# Altium project Trung Flight Controller.PrjPcb
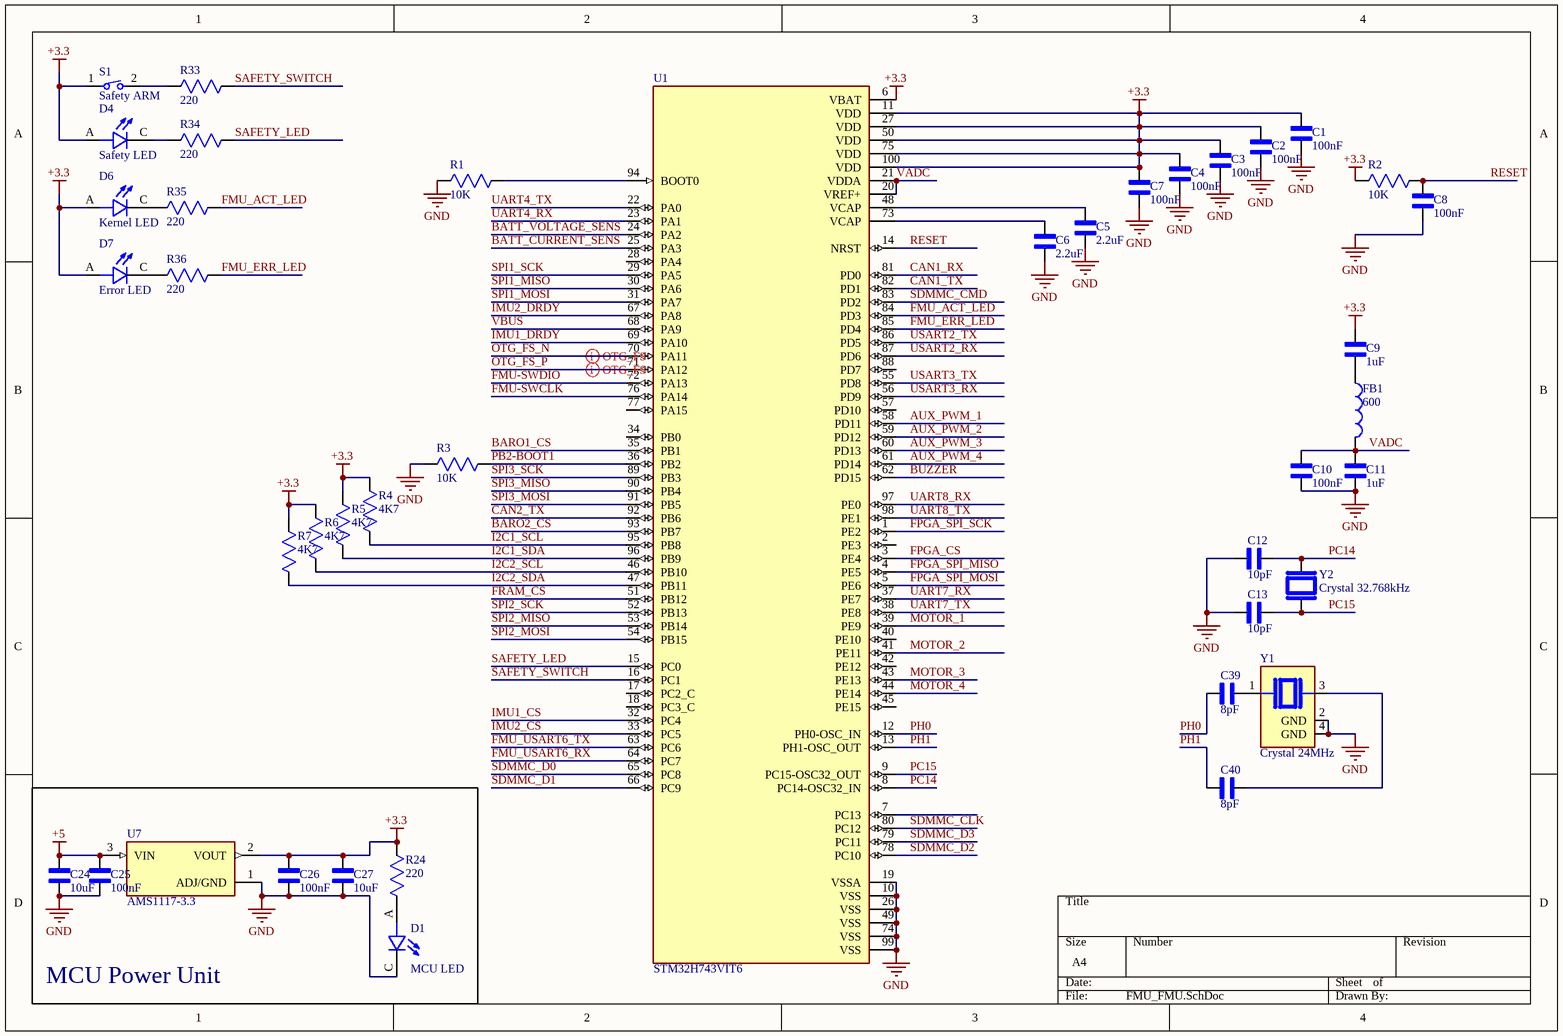
[diagram p0: FMU_FMU.SchDoc]
5 sheets, 114 parts. Net scope: global (net labels, ports and power ports of the same name join across sheets).
Board file: Trung PX4 Flight Controller PCB.PcbDoc
Sheets:
  FMU_FMU.SchDoc
  SD_FMU.SchDoc
  Sensor_FMU.SchDoc
  PWM_FMU.SchDoc
  Connector_FMU.SchDoc

## Sheet FMU_FMU.SchDoc
size A4; SheetNumber: 1; SheetTotal: 5

### Parts
C1  100nF  [CAPC1608X90N]
C2  100nF  [CAPC1608X90N]
C3  100nF  [CAPC1608X90N]
C4  100nF  [CAPC1608X90N]
C5  2.2uF  [CAPC1608X90N]
C6  2.2uF  [CAPC1608X90N]
C7  100nF  [CAPC1608X90N]
C8  100nF  [CAPC3216X127N]
C9  1uF  [CAPC1608X90N]
C10  100nF  [CAPC1608X90N]
C11  1uF  [CAPC1608X90N]
C12  10pF  [CAPC1608X90N]
C13  10pF  [CAPC1608X90N]
C24  10uF  [CAPC3216X110N]
C25  100nF  [CAPC2012X135N]
C26  100nF  [CAPC2012X135N]
C27  10uF  [CAPC3216X110N]
C39  8pF  [CAPC1005X55N]
C40  8pF  [CAPC1005X55N]
D1  MCU LED  [LEDSC125X200X90-2N]
D4  Safety LED  [LEDSC125X200X90-2N]
D6  Kernel LED  [LEDSC125X200X90-2N]
D7  Error LED  [LEDSC125X200X90-2N]
FB1  600  [WE-CBA_0805_W4.0]
R1  10K  [RESC2013X65N]
R2  10K  [RESC2013X65N]
R3  10K  [RESC2013X65N]
R4  4K7  [RESC2013X65N]
R5  4K7  [RESC2013X65N]
R6  4K7  [RESC2013X65N]
R7  4K7  [RESC2013X65N]
R24  220  [RESC2013X65N]
R33  220  [RESC2013X65N]
R34  220  [RESC2013X65N]
R35  220  [RESC2013X65N]
R36  220  [RESC2013X65N]
S1  Safety ARM  [434781025816]
U1  STM32H743VIT6  [QFP50P1600X1600X160-100N]
U7  AMS1117-3.3  [SOT229P700X180-4N]
Y1  Crystal 24MHz  [XTAL_ABM8G-24.000MHZ-B4Y-T]
Y2  Crystal 32.768kHz  [XTAL_CC7V-T1A-32.768KHZ-7PF-100PPM-TA-QC]

### Blocks framed on the sheet
MCU Power Unit: C24-C27 D1 R24 U7

### Nets
+3.3: C1.2 C2.2 C3.2 C4.2 C7.2 C9.2 C26.2 C27.1 D4.A D6.A D7.A R2.2(R2) R4.1(R1) R5.1(R1) R6.1(R1) R7.1(R1) R24.1(R1) S1.1 U1.6(VBAT) U1.11(VDD) U1.27(VDD) U1.50(VDD) U1.75(VDD) U1.100(VDD) U7.2(VOUT)
+5: C24.1 C25.2 U7.3(VIN)
GND: C1.1 C2.1 C3.1 C4.1 C5.1 C6.1 C7.1 C8.1 C10.1 C11.1 C12.2 C13.2 C24.2 C25.1 C26.1 C27.2 D1.C R1.2(R2) R3.2(R2) U1.10(VSS) U1.19(VSSA) U1.26(VSS) U1.49(VSS) U1.74(VSS) U1.99(VSS) U7.1(ADJ/GND) Y1.2(GND) Y1.4(GND)
AUX_PWM_1: U1.58(PD11)
AUX_PWM_2: U1.59(PD12)
AUX_PWM_3: U1.60(PD13)
AUX_PWM_4: U1.61(PD14)
BARO1_CS: U1.35(PB1)
BARO2_CS: U1.93(PB7)
BATT_CURRENT_SENS: U1.25(PA3)
BATT_VOLTAGE_SENS: U1.24(PA2)
BUZZER: U1.62(PD15)
CAN1_RX: U1.81(PD0)
CAN1_TX: U1.82(PD1)
CAN2_TX: U1.92(PB6)
FMU-SWCLK: U1.76(PA14)
FMU-SWDIO: U1.72(PA13)
FMU_ACT_LED: R35.2(R2) U1.84(PD3)
FMU_ERR_LED: R36.2(R2) U1.85(PD4)
FMU_USART6_RX: U1.64(PC7)
FMU_USART6_TX: U1.63(PC6)
FPGA_CS: U1.3(PE4)
FPGA_SPI_MISO: U1.4(PE5)
FPGA_SPI_MOSI: U1.5(PE6)
FPGA_SPI_SCK: U1.1(PE2)
FRAM_CS: U1.51(PB12)
I2C1_SCL: R4.2(R2) U1.95(PB8)
I2C1_SDA: R5.2(R2) U1.96(PB9)
I2C2_SCL: R6.2(R2) U1.46(PB10)
I2C2_SDA: R7.2(R2) U1.47(PB11)
IMU1_CS: U1.32(PC4)
IMU1_DRDY: U1.69(PA10)
IMU2_CS: U1.33(PC5)
IMU2_DRDY: U1.67(PA8)
MOTOR_1: U1.39(PE9)
MOTOR_2: U1.41(PE11)
MOTOR_3: U1.43(PE13)
MOTOR_4: U1.44(PE14)
OTG_FS_N: U1.70(PA11)
OTG_FS_P: U1.71(PA12)
PB2-BOOT1: R3.1(R1) U1.36(PB2)
PC14: C12.1 U1.8(PC14-OSC32_IN) Y2.2
PC15: C13.1 U1.9(PC15-OSC32_OUT) Y2.1
PH0: C39.1 U1.12(PH0-OSC_IN)
PH1: C40.1 U1.13(PH1-OSC_OUT)
RESET: C8.2 R2.1(R1) U1.14(NRST)
SAFETY_LED: R34.2(R2) U1.15(PC0)
SAFETY_SWITCH: R33.2(R2) U1.16(PC1)
SDMMC_CLK: U1.80(PC12)
SDMMC_CMD: U1.83(PD2)
SDMMC_D0: U1.65(PC8)
SDMMC_D1: U1.66(PC9)
SDMMC_D2: U1.78(PC10)
SDMMC_D3: U1.79(PC11)
SPI1_MISO: U1.30(PA6)
SPI1_MOSI: U1.31(PA7)
SPI1_SCK: U1.29(PA5)
SPI2_MISO: U1.53(PB14)
SPI2_MOSI: U1.54(PB15)
SPI2_SCK: U1.52(PB13)
SPI3_MISO: U1.90(PB4)
SPI3_MOSI: U1.91(PB5)
SPI3_SCK: U1.89(PB3)
UART4_RX: U1.23(PA1)
UART4_TX: U1.22(PA0)
UART7_RX: U1.37(PE7)
UART7_TX: U1.38(PE8)
UART8_RX: U1.97(PE0)
UART8_TX: U1.98(PE1)
USART2_RX: U1.87(PD6)
USART2_TX: U1.86(PD5)
USART3_RX: U1.56(PD9)
USART3_TX: U1.55(PD8)
VADC: C10.2 C11.2 FB1.2 U1.20(VREF+) U1.21(VDDA)
VBUS: U1.68(PA9)
NetC5_2: C5.2 U1.48(VCAP)
NetC6_2: C6.2 U1.73(VCAP)
NetC9_1: C9.1 FB1.1
NetC39_2: C39.2 Y1.1
NetC40_2: C40.2 Y1.3
NetD1_A: D1.A R24.2(R2)
NetD4_C: D4.C R34.1(R1)
NetD6_C: D6.C R35.1(R1)
NetD7_C: D7.C R36.1(R1)
NetR1_1: R1.1(R1) U1.94(BOOT0)
NetR33_1: R33.1(R1) S1.2

Not connected (* = marked no-connect by the designer): U1 2(PE3) 7(PC13) 17(PC2_C) 18(PC3_C) 28(PA4) 34(PB0) 40(PE10) 42(PE12) 45(PE15) 57(PD10) 77(PA15) 88(PD7)

### Layout directives
differential pair: OTG_FS_N, OTG_FS_P

### Library data of the parts
C1-C7 C9-C13 = GRM188R71H104KA93D: SMD Capacitor X7R(EIA) with Capacitance: 0.10uF Tol. 10%. Rated Voltage: 50Vdc; MF: Murata; SnapEDA_Link: https://www.snapeda.com/parts/GRM188R71H104KA93D/Murata/view-part/?ref=snap; Package: 1608 Murata; Value: *; MP: GRM188R71H104KA93D; Check_prices: https://www.snapeda.com/parts/GRM188R71H104KA93D/Murata/view-part/?ref=eda
C8 = 12061C104KAT2A: 0.1 ÂµF Â±10% 100V Ceramic Capacitor X7R 1206 (3216 Metric); MF: KYOCERA AVX; SnapEDA_Link: https://www.snapeda.com/parts/12061C104KAT2A/Kyocera/view-part/?ref=snap; Package: 3216 AVX; Value: *; MP: 12061C104KAT2A; Check_prices: https://www.snapeda.com/parts/12061C104KAT2A/Kyocera/view-part/?ref=eda
C24 C27 = T491A106K010AT7280: 10 ÂµF Molded Tantalum Capacitors 10 V 1206 (3216 Metric) 3.8Ohm; MF: KEMET; SnapEDA_Link: https://www.snapeda.com/parts/T491A106K010AT7280/KEMET/view-part/?ref=snap; Package: SMD-2 KEMET; Value: *; MP: T491A106K010AT7280; Check_prices: https://www.snapeda.com/parts/T491A106K010AT7280/KEMET/view-part/?ref=eda
C25 C26 = GRM21BR71H104KA01L: ÐšÐ¾Ð½Ð´ÐµÐ½ÑÐ°Ñ‚Ð¾Ñ€ SMD X7R(EIA) Ñ Ñ‘Ð¼ÐºÐ¾ÑÑ‚ÑŒÑŽ: 0,10 Ð¼ÐºÐ¤ Â± 10%. ÐÐ¾Ð¼Ð¸Ð½Ð°Ð»ÑŒÐ½Ð¾Ðµ Ð½Ð°Ð¿Ñ€ÑÐ¶ÐµÐ½Ð¸Ðµ: 50 Ð’ Ð¿Ð¾ÑÑ‚Ð¾ÑÐ½Ð½Ð¾Ð³Ð¾ Ñ‚Ð¾ÐºÐ°; MF: Murata; SnapEDA_Link: https://www.snapeda.com/parts/GRM21BR71H104KA01L/Murata/view-part/?ref=snap; Package: 805-2 Murata; Value: *; MP: GRM21BR71H104KA01L; Check_prices: https://www.snapeda.com/parts/GRM21BR71H104KA01L/Murata/view-part/?ref=eda
C39 C40 = C1005C0G1H080D050BA: 8 pF Â±0.5pF 50V Ceramic Capacitor C0G, NP0 0402 (1005 Metric); MF: TDK; SnapEDA_Link: https://www.snapeda.com/parts/C1005C0G1H080D050BA/TDK/view-part/?ref=snap; Package: 1005 TDK; Value: *; MP: C1005C0G1H080D050BA; Check_prices: https://www.snapeda.com/parts/C1005C0G1H080D050BA/TDK/view-part/?ref=eda
D1 D4 D6 D7 = 5990110007F: Red 633nm LED Indication - Discrete 2.1V 0805 (2012 Metric); MF: Dialight; MP: 599-0110-007F; Check_prices: https://www.snapeda.com/parts/599-0110-007F/Dialight/view-part/?ref=eda; Value: *; Purchase-URL: https://pricing.snapeda.com/search/part/599-0110-007F/?ref=eda; Price: None; SnapEDA_Link: https://www.snapeda.com/parts/599-0110-007F/Dialight/view-part/?ref=snap; Availability: In Stock; Package: 0805 Dialight
FB1 = WE-CBA_0805: FERRITE BEAD 560 OHM 0805 1LN; MF: WÃ¼rth Elektronik; MP: 782853561; SnapEDA_Link: https://www.snapeda.com/parts/782853561/W%25C3%25BCrth+Elektronik+Midcom/view-part/?ref=snap; Package: 0805 Wurth Elektronik; Value: *; Check_prices: https://www.snapeda.com/parts/782853561/W%25C3%25BCrth+Elektronik+Midcom/view-part/?ref=eda
R1-R7 R24 R33-R36 = RC0805FR-075K1L: 5.1 kOhms Â±1% 0.125W, 1/8W Chip Resistor 0805 (2012 Metric) Moisture Resistant Thick Film; MF: Yageo; MP: RC0805FR075K1L; SnapEDA_Link: https://www.snapeda.com/parts/RC0805FR075K1L/Yageo/view-part/?ref=snap; Package: 0805-2 YAGEO; Value: *; Check_prices: https://www.snapeda.com/parts/RC0805FR075K1L/Yageo/view-part/?ref=eda
S1 = 434781025816: 6.2*4.1mm IP67 vertical type, SMT, height 2.5mm, Black silicone rubber actuator, 160gf, T&R; MF: Wurth Elektronik; SnapEDA_Link: https://www.snapeda.com/parts/434781025816/Wurth+Electronics/view-part/?ref=snap; Package: None; Value: *; MP: 434781025816; Check_prices: https://www.snapeda.com/parts/434781025816/Wurth+Electronics/view-part/?ref=eda
U1 = STM32H743VIT6: ARMÂ® CortexÂ®-M7 STM32H7 Microcontroller IC 32-Bit Single-Core 480MHz 2MB (2M x 8) FLASH 100-LQFP (14x14); MF: STMicroelectronics; SnapEDA_Link: https://www.snapeda.com/parts/STM32H743VIT6/STMicroelectronics/view-part/?ref=snap; Package: LQFP-100 STMicroelectronics; Value: *; MP: STM32H743VIT6; Check_prices: https://www.snapeda.com/parts/STM32H743VIT6/STMicroelectronics/view-part/?ref=eda
U7 = AMS1117-3.3: Linear Voltage Regulator IC Positive Fixed 1 Output 1A SOT-223-3L; MF: UMW; SnapEDA_Link: https://www.snapeda.com/parts/AMS1117-3.3/UMW/view-part/?ref=snap; Package: SOT-223-3L UMW; Value: *; MP: AMS1117-3.3; Check_prices: https://www.snapeda.com/parts/AMS1117-3.3/UMW/view-part/?ref=eda
Y1 = ABM8G-24.000MHZ-B4Y-T: 24 MHz Â±30ppm Crystal 10pF 60 Ohms 4-SMD, No Lead; MF: Abracon; Value: *; SnapEDA_Link: https://www.snapeda.com/parts/ABM8G-24.000MHZ-B4Y-T/Abracon+LLC/view-part/?ref=snap; Availability: In Stock; Price: None; Check_prices: https://www.snapeda.com/parts/ABM8G-24.000MHZ-B4Y-T/Abracon+LLC/view-part/?ref=eda; Purchase-URL: https://pricing.snapeda.com/search/part/ABM8G-24.000MHZ-B4Y-T/?ref=eda; Package: SMD-4 Abracon; MP: ABM8G-24.000MHZ-B4Y-T
Y2 = CC7V-T1A-32.768KHZ-7PF-100PPM-TA-QC: LOW FREQUENCY CRYSTAL; MF: Micro Crystal; Package: SMD-2 Micro Crystal; MP: CC7V-T1A-32.768KHZ-7PF-100PPM-TA-QC; Check_prices: https://www.snapeda.com/parts/CC7V-T1A-32.768KHZ-7PF-100PPM-TA-QC/Micro+Crystal/view-part/?ref=eda; Digi-Key_Part_Number: 2195-CC7V-T1A-32.768KHZ-7PF-100PPM-TA-QCTR-ND; Purchase-URL: https://pricing.snapeda.com/search/part/CC7V-T1A-32.768KHZ-7PF-100PPM-TA-QC/?ref=eda; Value: *; SnapEDA_Link: https://www.snapeda.com/parts/CC7V-T1A-32.768KHZ-7PF-100PPM-TA-QC/Micro+Crystal/view-part/?ref=snap

## Sheet SD_FMU.SchDoc
size A4; SheetNumber: 2; SheetTotal: 5
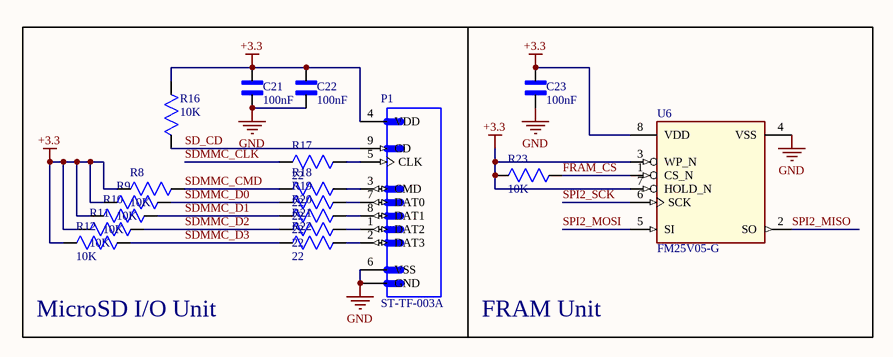
[diagram p1: SD_FMU.SchDoc]

### Parts
C21  100nF  [CAPC1608X90N]
C22  100nF  [CAPC1608X90N]
C23  100nF  [CAPC1608X90N]
P1  ST-TF-003A  [SUNTECH_ST-TF-003A]
R8  10K  [RESC2013X65N]
R9  10K  [RESC2013X65N]
R10  10K  [RESC2013X65N]
R11  10K  [RESC2013X65N]
R12  10K  [RESC2013X65N]
R16  10K  [RESC2013X65N]
R17  22  [RESC2013X65N]
R18  22  [RESC2013X65N]
R19  22  [RESC2013X65N]
R20  22  [RESC2013X65N]
R21  22  [RESC2013X65N]
R22  22  [RESC2013X65N]
R23  10K  [RESC2013X65N]
U6  FM25V05-G  [SOIC127P602X173-8N-1-V]

### Blocks framed on the sheet
MicroSD I/O Unit: C21 C22 P1 R8-R12 R16-R22
FRAM Unit: C23 R23 U6

### Nets
+3.3: C21.2 C22.2 C23.2 P1.4(VDD) R8.1(R1) R9.1(R1) R10.1(R1) R11.1(R1) R12.1(R1) R16.2(R2) R23.1(R1) U6.3(WP_N) U6.7(HOLD_N) U6.8(VDD)
GND: C21.1 C22.1 C23.1 P1.6(VSS) P1.G1(GND) P1.G2(GND) P1.G3(GND) P1.G4(GND) U6.4(VSS)
FRAM_CS: R23.2(R2) U6.1(CS_N)
SD_CD: P1.9(CD) R16.1(R1)
SDMMC_CLK: R17.1(R1)
SDMMC_CMD: R8.2(R2) R18.1(R1)
SDMMC_D0: R9.2(R2) R19.1(R1)
SDMMC_D1: R10.2(R2) R20.1(R1)
SDMMC_D2: R11.2(R2) R21.1(R1)
SDMMC_D3: R12.2(R2) R22.1(R1)
SPI2_MISO: U6.2(SO)
SPI2_MOSI: U6.5(SI)
SPI2_SCK: U6.6(SCK)
NetP1_1: P1.1(DAT2) R21.2(R2)
NetP1_2: P1.2(DAT3) R22.2(R2)
NetP1_3: P1.3(CMD) R18.2(R2)
NetP1_5: P1.5(CLK) R17.2(R2)
NetP1_7: P1.7(DAT0) R19.2(R2)
NetP1_8: P1.8(DAT1) R20.2(R2)

### Library data of the parts
C21-C23 = GRM188R71H104KA93D: as C1 on sheet FMU_FMU; SnapEDA_Link: https://www.snapeda.com/parts/GRM188R71H104KA93D/Murata/view-part/?ref=snap; Package: 1608 Murata; Value: *; MP: GRM188R71H104KA93D; Check_prices: https://www.snapeda.com/parts/GRM188R71H104KA93D/Murata/view-part/?ref=eda
P1 = ST-TF-003A: Micro SD Card Socket; Price: None; MP: ST-TF-003A; Availability: Unavailable; Value: *; Package: None
R8-R12 R16-R23 = RC0805FR-075K1L: as R1 on sheet FMU_FMU; SnapEDA_Link: https://www.snapeda.com/parts/RC0805FR075K1L/Yageo/view-part/?ref=snap; Package: 0805-2 YAGEO; Value: *; Check_prices: https://www.snapeda.com/parts/RC0805FR075K1L/Yageo/view-part/?ref=eda
U6 = FM25V05-G: 4-Kbit (512 × 8) Serial (SPI) F-RAM; Manufacturer: Infineon Technologies; PackageReference: PG-DSO-8-802; Manufacturer Order Number: FM25V05-G

## Sheet Sensor_FMU.SchDoc
size A4; SheetNumber: 3; SheetTotal: 5
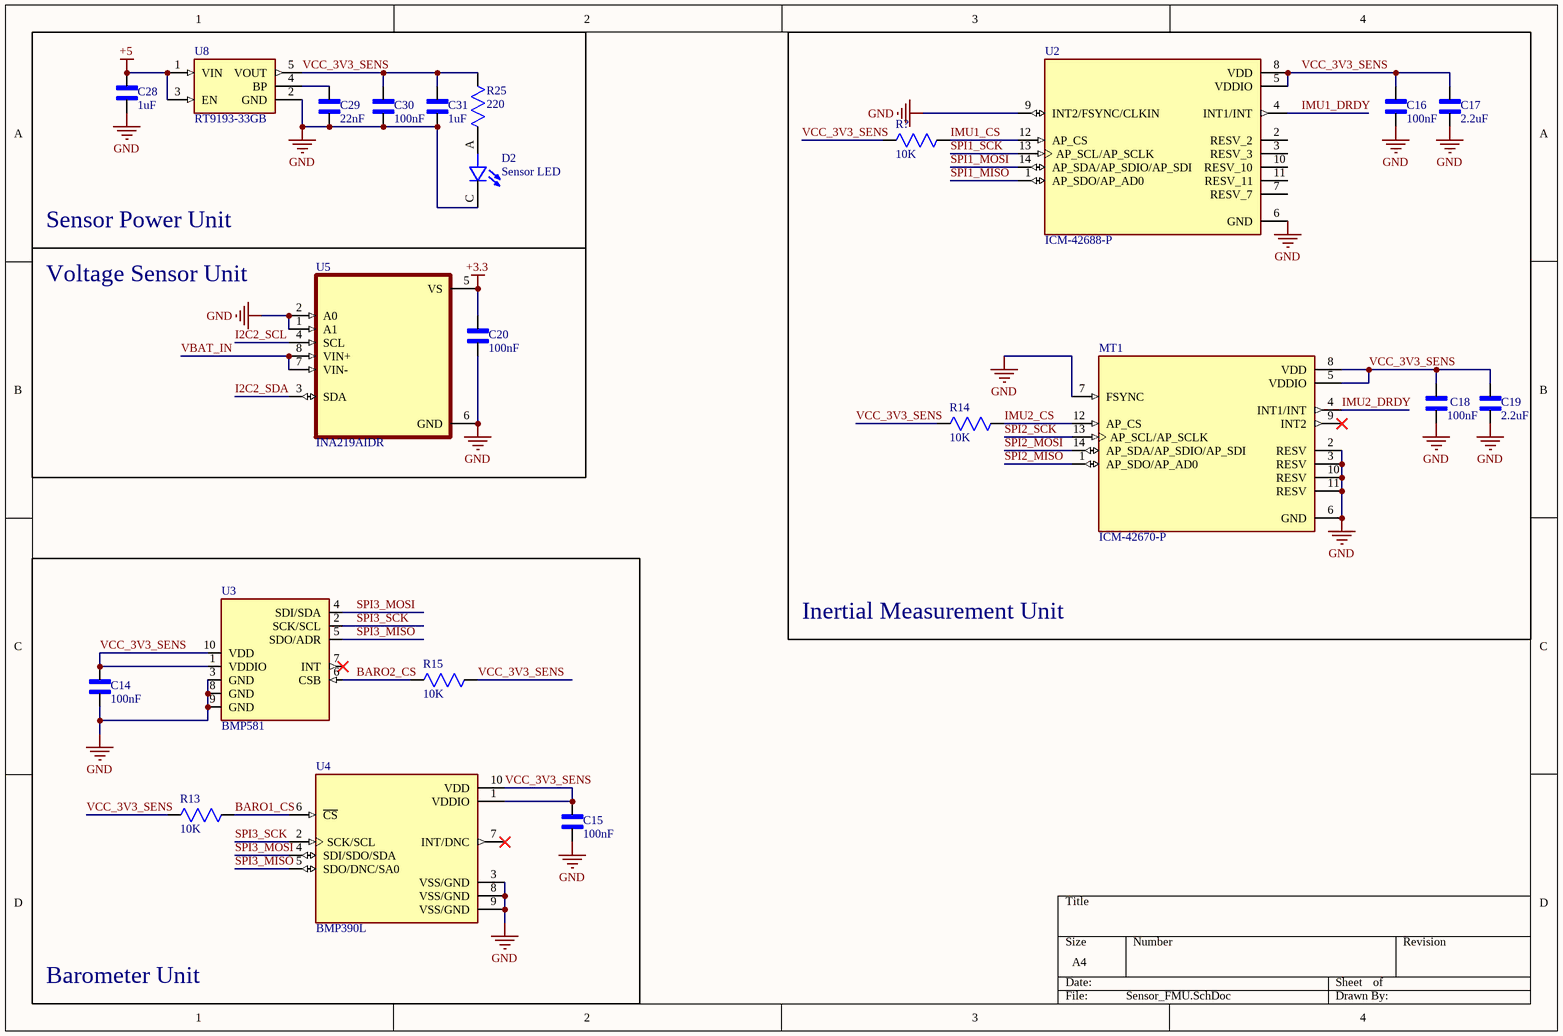
[diagram p2: Sensor_FMU.SchDoc]

### Parts
C14  100nF  [CAPC2012X135N]
C15  100nF  [CAPC2012X135N]
C16  100nF  [CAPC2012X135N]
C17  2.2uF  [CAPC2012X152N]
C18  100nF  [CAPC2012X135N]
C19  2.2uF  [CAPC2012X152N]
C20  100nF  [CAPC1608X90N]
C28  1uF  [CAPC1608X90N]
C29  22nF  [CAPC1608X90N]
C30  100nF  [CAPC1608X90N]
C31  1uF  [CAPC1608X90N]
D2  Sensor LED  [LEDSC125X200X90-2N]
MT1  ICM-42670-P  [XDCR_ICM-42670-P]
R13  10K  [RESC2013X65N]
R14  10K  [RESC2013X65N]
R15  10K  [RESC2013X65N]
R25  220  [RESC2013X65N]
R?  10K  [RESC2013X65N]
U2  ICM-42688-P  [PQFN50P300X250X97-14N]
U3  BMP581  [BMP581]
U4  BMP390L  [XDCR_BMP390L]
U5  INA219AIDR  [SOIC127P599X175-8N]
U8  RT9193-33GB  [SOT94P279X129-5N]

### Blocks framed on the sheet
Sensor Power Unit: C28-C31 D2 R25 U8
Inertial Measurement Unit: C16-C19 MT1 R14 R? U2
Voltage Sensor Unit: C20 U5
Barometer Unit: C14 C15 R13 R15 U3 U4

### Nets
+3.3: C20.2 U5.5(VS)
+5: C28.2 U8.1(VIN) U8.3(EN)
GND: C14.1 C15.1 C16.1 C17.2 C18.1 C19.2 C20.1 C28.1 C29.1 C30.1 C31.1 D2.C MT1.2(RESV) MT1.3(RESV) MT1.6(GND) MT1.7(FSYNC) MT1.10(RESV) MT1.11(RESV) U2.6(GND) U2.9(INT2/FSYNC/CLKIN) U3.3(GND) U3.8(GND) U3.9(GND) U4.3(VSS/GND) U4.8(VSS/GND) U4.9(VSS/GND) U5.1(A1) U5.2(A0) U5.6(GND) U8.2(GND)
BARO1_CS: R13.2(R2) U4.6(~{CS})
BARO2_CS: R15.2(R2) U3.6(CSB)
I2C2_SCL: U5.4(SCL)
I2C2_SDA: U5.3(SDA)
IMU1_CS: R?.2(R2) U2.12(AP_CS)
IMU1_DRDY: U2.4(INT1/INT)
IMU2_CS: MT1.12(AP_CS) R14.2(R2)
IMU2_DRDY: MT1.4(INT1/INT)
SPI1_MISO: U2.1(AP_SDO/AP_AD0)
SPI1_MOSI: U2.14(AP_SDA/AP_SDIO/AP_SDI)
SPI1_SCK: U2.13(AP_SCL/AP_SCLK)
SPI2_MISO: MT1.1(AP_SDO/AP_AD0)
SPI2_MOSI: MT1.14(AP_SDA/AP_SDIO/AP_SDI)
SPI2_SCK: MT1.13(AP_SCL/AP_SCLK)
SPI3_MISO: U3.5(SDO/ADR) U4.5(SDO/DNC/SA0)
SPI3_MOSI: U3.4(SDI/SDA) U4.4(SDI/SDO/SDA)
SPI3_SCK: U3.2(SCK/SCL) U4.2(SCK/SCL)
VBAT_IN: U5.7(VIN-) U5.8(VIN+)
VCC_3V3_SENS: C14.2 C15.2 C16.2 C17.1 C18.2 C19.1 C30.2 C31.2 MT1.5(VDDIO) MT1.8(VDD) R13.1(R1) R14.1(R1) R15.1(R1) R25.1(R1) R?.1(R1) U2.5(VDDIO) U2.8(VDD) U3.1(VDDIO) U3.10(VDD) U4.1(VDDIO) U4.10(VDD) U8.5(VOUT)
NetC29_2: C29.2 U8.4(BP)
NetD2_A: D2.A R25.2(R2)

Not connected (* = marked no-connect by the designer): MT1 9(INT2)*; U2 2(RESV_2) 3(RESV_3) 7(RESV_7) 10(RESV_10) 11(RESV_11); U3 7(INT)*; U4 7(INT/DNC)*

### Library data of the parts
C14-C16 C18 = GRM21BR71H104KA01L: as C25 on sheet FMU_FMU; SnapEDA_Link: https://www.snapeda.com/parts/GRM21BR71H104KA01L/Murata/view-part/?ref=snap; Package: 805-2 Murata; Value: *; MP: GRM21BR71H104KA01L; Check_prices: https://www.snapeda.com/parts/GRM21BR71H104KA01L/Murata/view-part/?ref=eda
C17 C19 = 08053C225K4Z2A: 2.2 ÂµF Â±10% 25V Ceramic Capacitor X7R 0805 (2012 Metric); MF: AVX; SnapEDA_Link: https://www.snapeda.com/parts/08053C225K4Z2A/AVX/view-part/?ref=snap; Package: 2012 AVX; Value: *; MP: 08053C225K4Z2A; Check_prices: https://www.snapeda.com/parts/08053C225K4Z2A/AVX/view-part/?ref=eda
C20 C28-C31 = GRM188R71H104KA93D: as C1 on sheet FMU_FMU; SnapEDA_Link: https://www.snapeda.com/parts/GRM188R71H104KA93D/Murata/view-part/?ref=snap; Package: 1608 Murata; Value: *; MP: GRM188R71H104KA93D; Check_prices: https://www.snapeda.com/parts/GRM188R71H104KA93D/Murata/view-part/?ref=eda
D2 = 5990110007F: as D1 on sheet FMU_FMU; Check_prices: https://www.snapeda.com/parts/599-0110-007F/Dialight/view-part/?ref=eda; Value: *; Purchase-URL: https://pricing.snapeda.com/search/part/599-0110-007F/?ref=eda; Price: None; SnapEDA_Link: https://www.snapeda.com/parts/599-0110-007F/Dialight/view-part/?ref=snap; Availability: In Stock; Package: 0805 Dialight
R13-R15 R25 R? = RC0805FR-075K1L: as R1 on sheet FMU_FMU; SnapEDA_Link: https://www.snapeda.com/parts/RC0805FR075K1L/Yageo/view-part/?ref=snap; Package: 0805-2 YAGEO; Value: *; Check_prices: https://www.snapeda.com/parts/RC0805FR075K1L/Yageo/view-part/?ref=eda
U2 = ICM-42688-P: Accelerometer, Gyroscope, 6 Axis Sensor Output; Package: None; MP: ICM-42688-P; Value: *; Availability: Unavailable; Price: None
U3 = BMP581: Very small, low-power and low noise 24-bit absolute barometric pressure sensor. This digital, high-performance sensor is ideally suited for a wide range of altitude tracking applications and offers outstanding design flexibility; MF: Bosch; SnapEDA_Link: https://www.snapeda.com/parts/BMP581/Bosch/view-part/?ref=snap; Package: None; Value: *; MP: BMP581; Check_prices: https://www.snapeda.com/parts/BMP581/Bosch/view-part/?ref=eda
U4 = BMP390L: Pressure Sensor 4.35PSI ~ 18.13PSI (30kPa ~ 125kPa) Absolute - - 10-WFLGA; MF: Bosch Sensortec; SnapEDA_Link: https://www.snapeda.com/parts/BMP390L/Bosch+Sensortec/view-part/?ref=snap; Package: None; Value: *; MP: BMP390L; Check_prices: https://www.snapeda.com/parts/BMP390L/Bosch+Sensortec/view-part/?ref=eda
U5 = INA219AIDR: 26-V 12-bit I2C output digital power monitor; MF: Texas Instruments; SnapEDA_Link: https://www.snapeda.com/parts/INA219AIDR/Texas+Instruments/view-part/?ref=snap; Package: SOIC-8 Texas Instruments; Value: *; MP: INA219AIDR; Check_prices: https://www.snapeda.com/parts/INA219AIDR/Texas+Instruments/view-part/?ref=eda
U8 = RT9193-33GB: Linear Voltage Regulator IC Positive Fixed 1 Output 300mA TSOT-23-5; MF: Richtek USA; SnapEDA_Link: https://www.snapeda.com/parts/RT9193-33GB/Richtek+USA+Inc./view-part/?ref=snap; Package: SOT-23-5 Richtek; MP: RT9193-33GB; Check_prices: https://www.snapeda.com/parts/RT9193-33GB/Richtek+USA+Inc./view-part/?ref=eda; Purchase-URL: https://pricing.snapeda.com/search/part/RT9193-33GB/?ref=eda; Digi-Key_Part_Number: 1028-1014-2-ND; Value: *
MT1 = ICM-42670-P: Package: None; Price: None; Value: *; MP: ICM-42670-P; Availability: Unavailable

## Sheet PWM_FMU.SchDoc
size A4; SheetNumber: 4; SheetTotal: 5
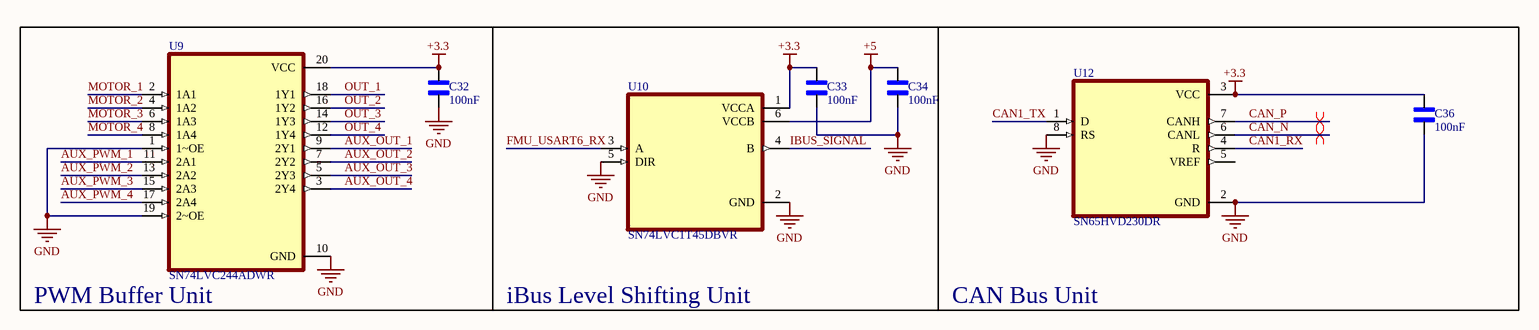
[diagram p3: PWM_FMU.SchDoc]

### Parts
C32  100nF  [CAPC2012X135N]
C33  100nF  [CAPC2012X135N]
C34  100nF  [CAPC2012X135N]
C36  100nF  [CAPC2012X135N]
U9  SN74LVC244ADWR  [SOIC127P1030X265-20N]
U10  SN74LVC1T45DBVR  [SOT95P280X145-6N]
U12  SN65HVD230DR  [SOIC127P599X175-8N]

### Blocks framed on the sheet
PWM Buffer Unit: C32 U9
iBus Level Shifting Unit: C33 C34 U10
CAN Bus Unit: C36 U12

### Nets
+3.3: C32.2 C33.2 C36.2 U9.20(VCC) U10.1(VCCA) U12.3(VCC)
+5: C34.2 U10.6(VCCB)
GND: C32.1 C33.1 C34.1 C36.1 U9.1(1~OE) U9.10(GND) U9.19(2~OE) U10.2(GND) U10.5(DIR) U12.2(GND) U12.8(RS)
AUX_OUT_1: U9.9(2Y1)
AUX_OUT_2: U9.7(2Y2)
AUX_OUT_3: U9.5(2Y3)
AUX_OUT_4: U9.3(2Y4)
AUX_PWM_1: U9.11(2A1)
AUX_PWM_2: U9.13(2A2)
AUX_PWM_3: U9.15(2A3)
AUX_PWM_4: U9.17(2A4)
CAN1_RX: U12.4(R)
CAN1_TX: U12.1(D)
CAN_N: U12.6(CANL)
CAN_P: U12.7(CANH)
FMU_USART6_RX: U10.3(A)
IBUS_SIGNAL: U10.4(B)
MOTOR_1: U9.2(1A1)
MOTOR_2: U9.4(1A2)
MOTOR_3: U9.6(1A3)
MOTOR_4: U9.8(1A4)
OUT_1: U9.18(1Y1)
OUT_2: U9.16(1Y2)
OUT_3: U9.14(1Y3)
OUT_4: U9.12(1Y4)

Not connected (* = marked no-connect by the designer): U12 5(VREF)

### Layout directives
differential pair: CAN_N, CAN_P

### Library data of the parts
C32-C34 C36 = GRM21BR71H104KA01L: as C25 on sheet FMU_FMU; SnapEDA_Link: https://www.snapeda.com/parts/GRM21BR71H104KA01L/Murata/view-part/?ref=snap; Package: 805-2 Murata; Value: *; MP: GRM21BR71H104KA01L; Check_prices: https://www.snapeda.com/parts/GRM21BR71H104KA01L/Murata/view-part/?ref=eda
U9 = SN74LVC244ADWR: 8-ch, 1.65-V to 3.6-V buffers with 3-state outputs; MF: Texas Instruments; SnapEDA_Link: https://www.snapeda.com/parts/SN74LVC244ADWR/Texas+Instruments/view-part/?ref=snap; Package: SOIC-20 Texas Instruments; Value: *; MP: SN74LVC244ADWR; Check_prices: https://www.snapeda.com/parts/SN74LVC244ADWR/Texas+Instruments/view-part/?ref=eda
U10 = SN74LVC1T45DBVR: Single-Bit Dual-Supply Bus Transceiver with Configurable Voltage-Level Shifting and 3-State Outputs; MF: Texas Instruments; SnapEDA_Link: https://www.snapeda.com/parts/SN74LVC1T45DBVR/Texas+Instruments/view-part/?ref=snap; Package: SOT-23-6 Texas Instruments; Value: *; MP: SN74LVC1T45DBVR; Check_prices: https://www.snapeda.com/parts/SN74LVC1T45DBVR/Texas+Instruments/view-part/?ref=eda
U12 = SN65HVD230DR: 3.3 V CAN Transceiver with Standby Mode; MF: Texas Instruments; SnapEDA_Link: https://www.snapeda.com/parts/SN65HVD230DR/Texas+Instruments/view-part/?ref=snap; Package: SOIC-8 Texas Instruments; Value: *; MP: SN65HVD230DR; Check_prices: https://www.snapeda.com/parts/SN65HVD230DR/Texas+Instruments/view-part/?ref=eda

## Sheet Connector_FMU.SchDoc
size A4; SheetNumber: 5; SheetTotal: 5
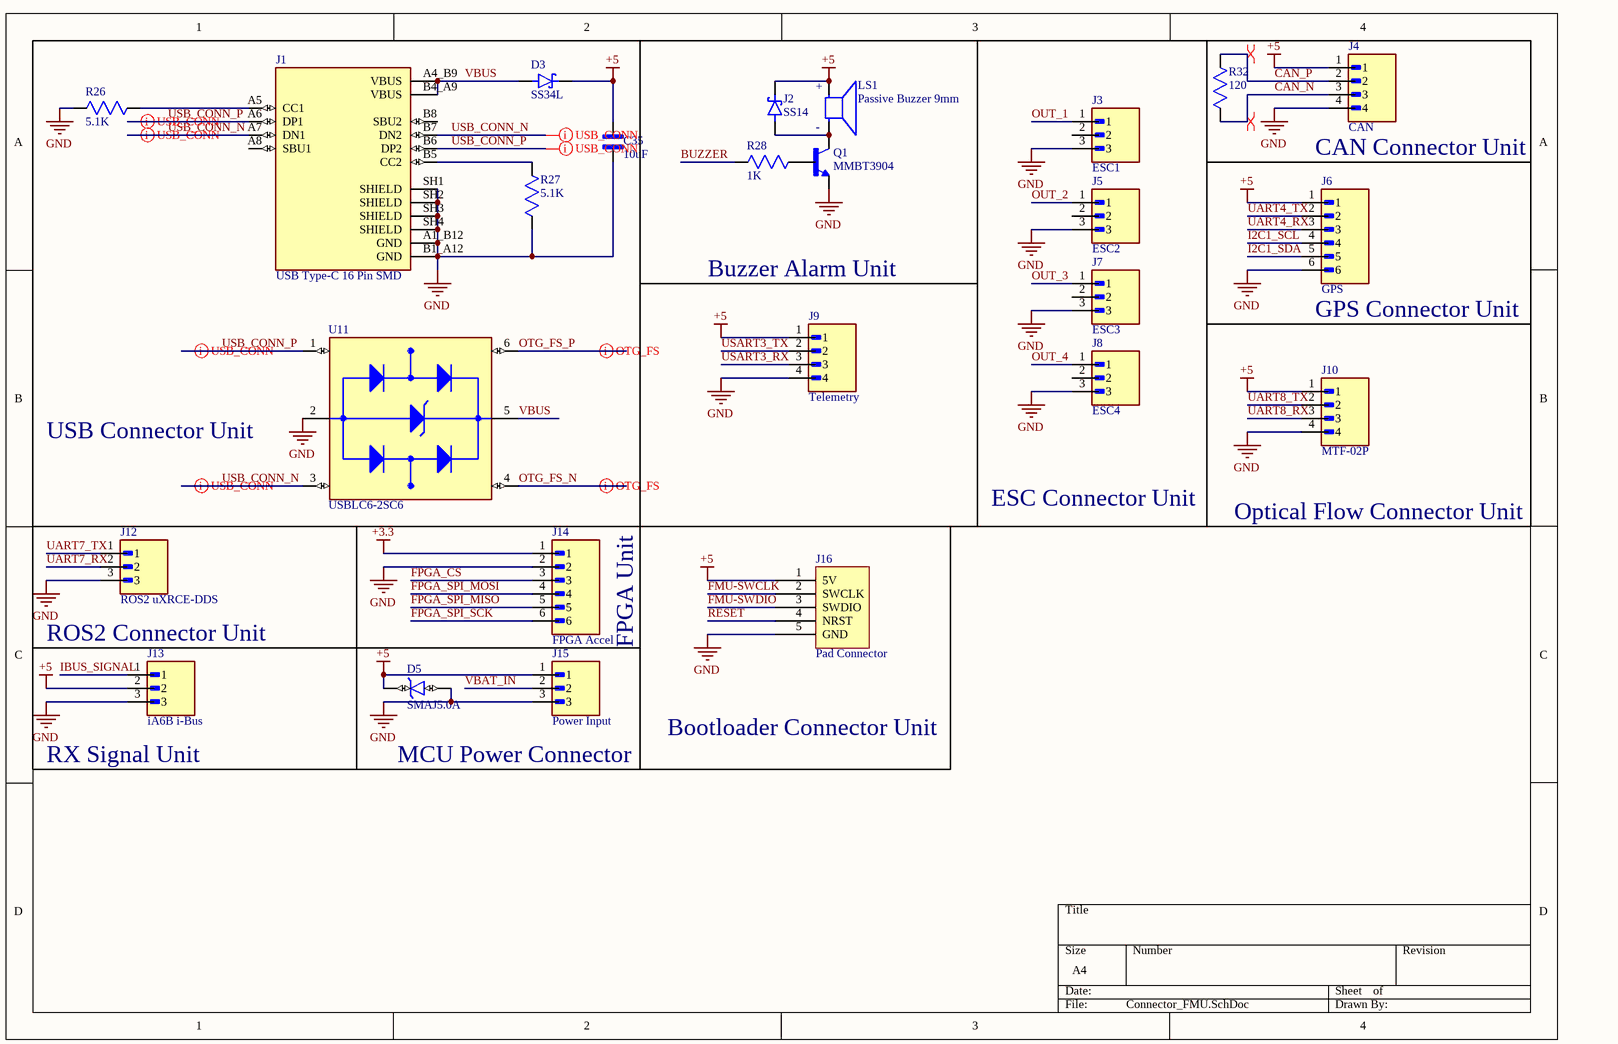
[diagram p4: Connector_FMU.SchDoc]

### Parts
C35  10uF  [CAPC2012X135N]
D3  SS34L  [SODFL3618X143N]
D5  SMAJ5.0A  [DIOM5026X229N]
J1  USB Type-C 16 Pin SMD  [AMPHENOL_10155435-00011LF]
J2  SS14  [SMA]
J3  ESC1  [JST_S3B-XH-SM4-TB]
J4  CAN  [JST_S4B-XH-SM4-TB]
J5  ESC2  [JST_S3B-XH-SM4-TB]
J6  GPS  [JST_S6B-XH-SM4-TB]
J7  ESC3  [JST_S3B-XH-SM4-TB]
J8  ESC4  [JST_S3B-XH-SM4-TB]
J9  Telemetry  [JST_S4B-XH-SM4-TB]
J10  MTF-02P  [JST_S4B-XH-SM4-TB]
J12  ROS2 uXRCE-DDS  [JST_S3B-XH-SM4-TB]
J13  iA6B i-Bus  [JST_S3B-XH-SM4-TB]
J14  FPGA Accel  [JST_S6B-XH-SM4-TB]
J15  Power Input  [JST_S3B-XH-SM4-TB]
J16  Pad Connector  [Pad Connector PCB]
LS1  Passive Buzzer 9mm  [XDCR_AT-0927-TT-2-R]
Q1  MMBT3904  [TRANS_MMBT3904]
R26  5.1K  [RESC2013X65N]
R27  5.1K  [RESC2013X65N]
R28  1K  [RESC2013X65N]
R32  120  [RESC2013X65N]
U11  USBLC6-2SC6  [SOT95P280X145-6N]

### Blocks framed on the sheet
USB Connector Unit: C35 D3 J1 R26 R27 U11
Buzzer Alarm Unit: J2 LS1 Q1 R28
ESC Connector Unit: J3 J5 J7 J8
CAN Connector Unit: J4 R32
Optical Flow Connector Unit: J10
GPS Connector Unit: J6
ROS2 Connector Unit: J12
RX Signal Unit: J13

### Nets
+3.3: J14.1
+5: C35.2 D3.C(K) D5.1(K) J2.P2(C) J4.1 J6.1 J9.1 J10.1 J13.2 J15.1 J16.1(5V) LS1.P
GND: C35.1 D5.2(A) J1.A1_B12(GND) J1.B1_A12(GND) J1.SH1(SHIELD) J1.SH2(SHIELD) J1.SH3(SHIELD) J1.SH4(SHIELD) J3.3 J4.4 J5.3 J6.6 J7.3 J8.3 J9.4 J10.4 J12.3 J13.3 J14.2 J15.3 J16.5(GND) Q1.2(E) R26.1(R1) R27.1(R1) U11.2(GND)
BUZZER: R28.2(R2)
CAN_N: J4.3 R32.2(R2)
CAN_P: J4.2 R32.1(R1)
FMU-SWCLK: J16.2(SWCLK)
FMU-SWDIO: J16.3(SWDIO)
FPGA_CS: J14.3
FPGA_SPI_MISO: J14.5
FPGA_SPI_MOSI: J14.4
FPGA_SPI_SCK: J14.6
I2C1_SCL: J6.4
I2C1_SDA: J6.5
IBUS_SIGNAL: J13.1
OTG_FS_N: U11.4(I/O2_OUT)
OTG_FS_P: U11.6(I/O1_OUT)
OUT_1: J3.1
OUT_2: J5.1
OUT_3: J7.1
OUT_4: J8.1
RESET: J16.4(NRST)
UART4_RX: J6.3
UART4_TX: J6.2
UART7_RX: J12.2
UART7_TX: J12.1
UART8_RX: J10.3
UART8_TX: J10.2
USART3_RX: J9.3
USART3_TX: J9.2
USB_CONN_N: J1.A7(DN1) J1.B7(DN2) U11.3(I/O2_IN)
USB_CONN_P: J1.A6(DP1) J1.B6(DP2) U11.1(I/O1_IN)
VBAT_IN: J15.2
VBUS: D3.A J1.A4_B9(VBUS) J1.B4_A9(VBUS) U11.5(VBUS)
NetJ1_A5: J1.A5(CC1) R26.2(R2)
NetJ1_B5: J1.B5(CC2) R27.2(R2)
NetJ2_P1: J2.P1(A) LS1.N Q1.3(C)
NetQ1_1: Q1.1(B) R28.1(R1)

Not connected (* = marked no-connect by the designer): J1 A8(SBU1) B8(SBU2); J3 2; J5 2; J7 2; J8 2

### Layout directives
differential pair: CAN_N, CAN_P, OTG_FS_N, OTG_FS_P, USB_CONN_N, USB_CONN_P

### Notes on the sheet
- FPGA Unit
- MCU Power Connector
- Bootloader Connector Unit
- (in symbol AT-0927-TT-2-R) +; -

### Library data of the parts
C35 = GRM21BR61C106KE15L: 10 ÂµF Â±10% 16V Ceramic Capacitor X5R 0805 (2012 Metric); MF: Murata; SnapEDA_Link: https://www.snapeda.com/parts/GRM21BR61C106KE15L/Murata/view-part/?ref=snap; Package: 805-2 Murata; Value: *; MP: GRM21BR61C106KE15L; Check_prices: https://www.snapeda.com/parts/GRM21BR61C106KE15L/Murata/view-part/?ref=eda
D3 = SS34L: 3A, 40V, Planar Schottky; MF: Taiwan Semiconductor; SnapEDA_Link: https://www.snapeda.com/parts/SS34L/taiwan/view-part/?ref=snap; Package: SUB SMA-2 Taiwan Semiconductor; Value: *; MP: SS34L; Check_prices: https://www.snapeda.com/parts/SS34L/taiwan/view-part/?ref=eda
D5 = SMAJ5.0A: A 5.0V, 400W, uni-directional, SMA pkg TVS Diode | Bourns SMAJ5.0A; SnapEDA_Link: https://www.snapeda.com/parts/SMAJ5.0A/Bourns/view-part/?ref=snap; Package: DO-214 Bourns; Value: *; MF: Bourns; MP: SMAJ5.0A; Check_prices: https://www.snapeda.com/parts/SMAJ5.0A/Bourns/view-part/?ref=eda
J1 = 10155435-00011LF: Package: None; Price: None; Value: *; MP: 10155435-00011LF; Availability: Unavailable
J2 = SS14: Diode Schottky 40 V 1A Surface Mount DO-214AC (SMA); MF: onsemi; SnapEDA_Link: https://www.snapeda.com/parts/SS14/Onsemi/view-part/?ref=snap; Package: SMA-2 ON Semiconductor; Value: *; MP: SS14; Check_prices: https://www.snapeda.com/parts/SS14/Onsemi/view-part/?ref=eda
J3 J5 J7 J8 J12 J13 J15 = S3B-XH-SM3-TB: Connector Header Surface Mount, Right Angle 4 position 0.098 (2.50mm); MF: JST Sales; MP: S4B/XH/SM4/TB; SnapEDA_Link: https://www.snapeda.com/parts/S4B/XH/SM4/TB/JST/view-part/?ref=snap; Package: None; Value: *; Check_prices: https://www.snapeda.com/parts/S4B/XH/SM4/TB/JST/view-part/?ref=eda
J4 J9 J10 = S4B-XH-SM4-TB: Connector Header Surface Mount, Right Angle 4 position 0.098 (2.50mm); MF: JST Sales; MP: S4B/XH/SM4/TB; SnapEDA_Link: https://www.snapeda.com/parts/S4B/XH/SM4/TB/JST/view-part/?ref=snap; Package: None; Value: *; Check_prices: https://www.snapeda.com/parts/S4B/XH/SM4/TB/JST/view-part/?ref=eda
J6 J14 = S6B-XH-SM4-TB: Connector Header Surface Mount, Right Angle 4 position 0.098 (2.50mm); MF: JST Sales; MP: S4B/XH/SM4/TB; SnapEDA_Link: https://www.snapeda.com/parts/S4B/XH/SM4/TB/JST/view-part/?ref=snap; Package: None; Value: *; Check_prices: https://www.snapeda.com/parts/S4B/XH/SM4/TB/JST/view-part/?ref=eda
LS1 = AT-0927-TT-2-R: AUDIO TRANSDUCER 3VP-P 70MA 20OHM 86DBA; MF: {'manufacturer': u'PUI Audio, Inc.'}; Package: None; Price: None; Value: *; MP: AT-0927-TT-2-R; Availability: Unavailable
Q1 = MMBT3904: BJT, SOT-23, 40V, 200mA, NPN, 0.35W, 150Â°C; MF: Diotec Semiconductor; SnapEDA_Link: https://www.snapeda.com/parts/MMBT3904/Diotec/view-part/?ref=snap; Package: SOT-23 Diotec; Value: *; MP: MMBT3904; Check_prices: https://www.snapeda.com/parts/MMBT3904/Diotec/view-part/?ref=eda
R26-R28 R32 = RC0805FR-075K1L: as R1 on sheet FMU_FMU; SnapEDA_Link: https://www.snapeda.com/parts/RC0805FR075K1L/Yageo/view-part/?ref=snap; Package: 0805-2 YAGEO; Value: *; Check_prices: https://www.snapeda.com/parts/RC0805FR075K1L/Yageo/view-part/?ref=eda
U11 = USBLC6-2SC6: 17V Clamp 5A (8/20Âµs) Ipp Tvs Diode Surface Mount SOT-23-6; MF: STMicroelectronics; Value: *; SnapEDA_Link: https://www.snapeda.com/parts/USBLC6-2SC6/STMicroelectronics/view-part/?ref=snap; Check_prices: https://www.snapeda.com/parts/USBLC6-2SC6/STMicroelectronics/view-part/?ref=eda; Purchase-URL: https://pricing.snapeda.com/search/part/USBLC6-2SC6/?ref=eda; Price: None; Availability: In Stock; Package: SOT-23-6 STMicroelectronics; MP: USBLC6-2SC6

## Nets that join several sheets
+3.3: FMU_FMU (25 pins), SD_FMU (14 pins), Sensor_FMU (C20.2 U5.5), PWM_FMU (6 pins), Connector_FMU (J14.1)
+5: FMU_FMU (C24.1 C25.2 U7.3), Sensor_FMU (C28.2 U8.1 U8.3), PWM_FMU (C34.2 U10.6), Connector_FMU (12 pins)
GND: FMU_FMU (28 pins), SD_FMU (9 pins), Sensor_FMU (30 pins), PWM_FMU (11 pins), Connector_FMU (25 pins)
AUX_PWM_1: FMU_FMU (U1.58), PWM_FMU (U9.11)
AUX_PWM_2: FMU_FMU (U1.59), PWM_FMU (U9.13)
AUX_PWM_3: FMU_FMU (U1.60), PWM_FMU (U9.15)
AUX_PWM_4: FMU_FMU (U1.61), PWM_FMU (U9.17)
BARO1_CS: FMU_FMU (U1.35), Sensor_FMU (R13.2 U4.6)
BARO2_CS: FMU_FMU (U1.93), Sensor_FMU (R15.2 U3.6)
BUZZER: FMU_FMU (U1.62), Connector_FMU (R28.2)
CAN1_RX: FMU_FMU (U1.81), PWM_FMU (U12.4)
CAN1_TX: FMU_FMU (U1.82), PWM_FMU (U12.1)
CAN_N: PWM_FMU (U12.6), Connector_FMU (J4.3 R32.2)
CAN_P: PWM_FMU (U12.7), Connector_FMU (J4.2 R32.1)
FMU-SWCLK: FMU_FMU (U1.76), Connector_FMU (J16.2)
FMU-SWDIO: FMU_FMU (U1.72), Connector_FMU (J16.3)
FMU_USART6_RX: FMU_FMU (U1.64), PWM_FMU (U10.3)
FPGA_CS: FMU_FMU (U1.3), Connector_FMU (J14.3)
FPGA_SPI_MISO: FMU_FMU (U1.4), Connector_FMU (J14.5)
FPGA_SPI_MOSI: FMU_FMU (U1.5), Connector_FMU (J14.4)
FPGA_SPI_SCK: FMU_FMU (U1.1), Connector_FMU (J14.6)
FRAM_CS: FMU_FMU (U1.51), SD_FMU (R23.2 U6.1)
I2C1_SCL: FMU_FMU (R4.2 U1.95), Connector_FMU (J6.4)
I2C1_SDA: FMU_FMU (R5.2 U1.96), Connector_FMU (J6.5)
I2C2_SCL: FMU_FMU (R6.2 U1.46), Sensor_FMU (U5.4)
I2C2_SDA: FMU_FMU (R7.2 U1.47), Sensor_FMU (U5.3)
IBUS_SIGNAL: PWM_FMU (U10.4), Connector_FMU (J13.1)
IMU1_CS: FMU_FMU (U1.32), Sensor_FMU (R?.2 U2.12)
IMU1_DRDY: FMU_FMU (U1.69), Sensor_FMU (U2.4)
IMU2_CS: FMU_FMU (U1.33), Sensor_FMU (MT1.12 R14.2)
IMU2_DRDY: FMU_FMU (U1.67), Sensor_FMU (MT1.4)
MOTOR_1: FMU_FMU (U1.39), PWM_FMU (U9.2)
MOTOR_2: FMU_FMU (U1.41), PWM_FMU (U9.4)
MOTOR_3: FMU_FMU (U1.43), PWM_FMU (U9.6)
MOTOR_4: FMU_FMU (U1.44), PWM_FMU (U9.8)
OTG_FS_N: FMU_FMU (U1.70), Connector_FMU (U11.4)
OTG_FS_P: FMU_FMU (U1.71), Connector_FMU (U11.6)
OUT_1: PWM_FMU (U9.18), Connector_FMU (J3.1)
OUT_2: PWM_FMU (U9.16), Connector_FMU (J5.1)
OUT_3: PWM_FMU (U9.14), Connector_FMU (J7.1)
OUT_4: PWM_FMU (U9.12), Connector_FMU (J8.1)
RESET: FMU_FMU (C8.2 R2.1 U1.14), Connector_FMU (J16.4)
SDMMC_CLK: FMU_FMU (U1.80), SD_FMU (R17.1)
SDMMC_CMD: FMU_FMU (U1.83), SD_FMU (R8.2 R18.1)
SDMMC_D0: FMU_FMU (U1.65), SD_FMU (R9.2 R19.1)
SDMMC_D1: FMU_FMU (U1.66), SD_FMU (R10.2 R20.1)
SDMMC_D2: FMU_FMU (U1.78), SD_FMU (R11.2 R21.1)
SDMMC_D3: FMU_FMU (U1.79), SD_FMU (R12.2 R22.1)
SPI1_MISO: FMU_FMU (U1.30), Sensor_FMU (U2.1)
SPI1_MOSI: FMU_FMU (U1.31), Sensor_FMU (U2.14)
SPI1_SCK: FMU_FMU (U1.29), Sensor_FMU (U2.13)
SPI2_MISO: FMU_FMU (U1.53), SD_FMU (U6.2), Sensor_FMU (MT1.1)
SPI2_MOSI: FMU_FMU (U1.54), SD_FMU (U6.5), Sensor_FMU (MT1.14)
SPI2_SCK: FMU_FMU (U1.52), SD_FMU (U6.6), Sensor_FMU (MT1.13)
SPI3_MISO: FMU_FMU (U1.90), Sensor_FMU (U3.5 U4.5)
SPI3_MOSI: FMU_FMU (U1.91), Sensor_FMU (U3.4 U4.4)
SPI3_SCK: FMU_FMU (U1.89), Sensor_FMU (U3.2 U4.2)
UART4_RX: FMU_FMU (U1.23), Connector_FMU (J6.3)
UART4_TX: FMU_FMU (U1.22), Connector_FMU (J6.2)
UART7_RX: FMU_FMU (U1.37), Connector_FMU (J12.2)
UART7_TX: FMU_FMU (U1.38), Connector_FMU (J12.1)
UART8_RX: FMU_FMU (U1.97), Connector_FMU (J10.3)
UART8_TX: FMU_FMU (U1.98), Connector_FMU (J10.2)
USART3_RX: FMU_FMU (U1.56), Connector_FMU (J9.3)
USART3_TX: FMU_FMU (U1.55), Connector_FMU (J9.2)
VBAT_IN: Sensor_FMU (U5.7 U5.8), Connector_FMU (J15.2)
VBUS: FMU_FMU (U1.68), Connector_FMU (D3.A J1.A4_B9 J1.B4_A9 U11.5)